# EasyEDA Pro project ESP32多功能手表工程文件.epro

# Schematic Schematic1
Assembly Variant: Basic; Board Name: Board1; Create Date: 2026-06-11; Page Name: P1; Project Name: ESP32-S3多功能手表v4.0; Schematic Name: Schematic1; Update Date: 2026-06-11; Company: 嘉立创EDA; Page Size: A4; Version: V1.0
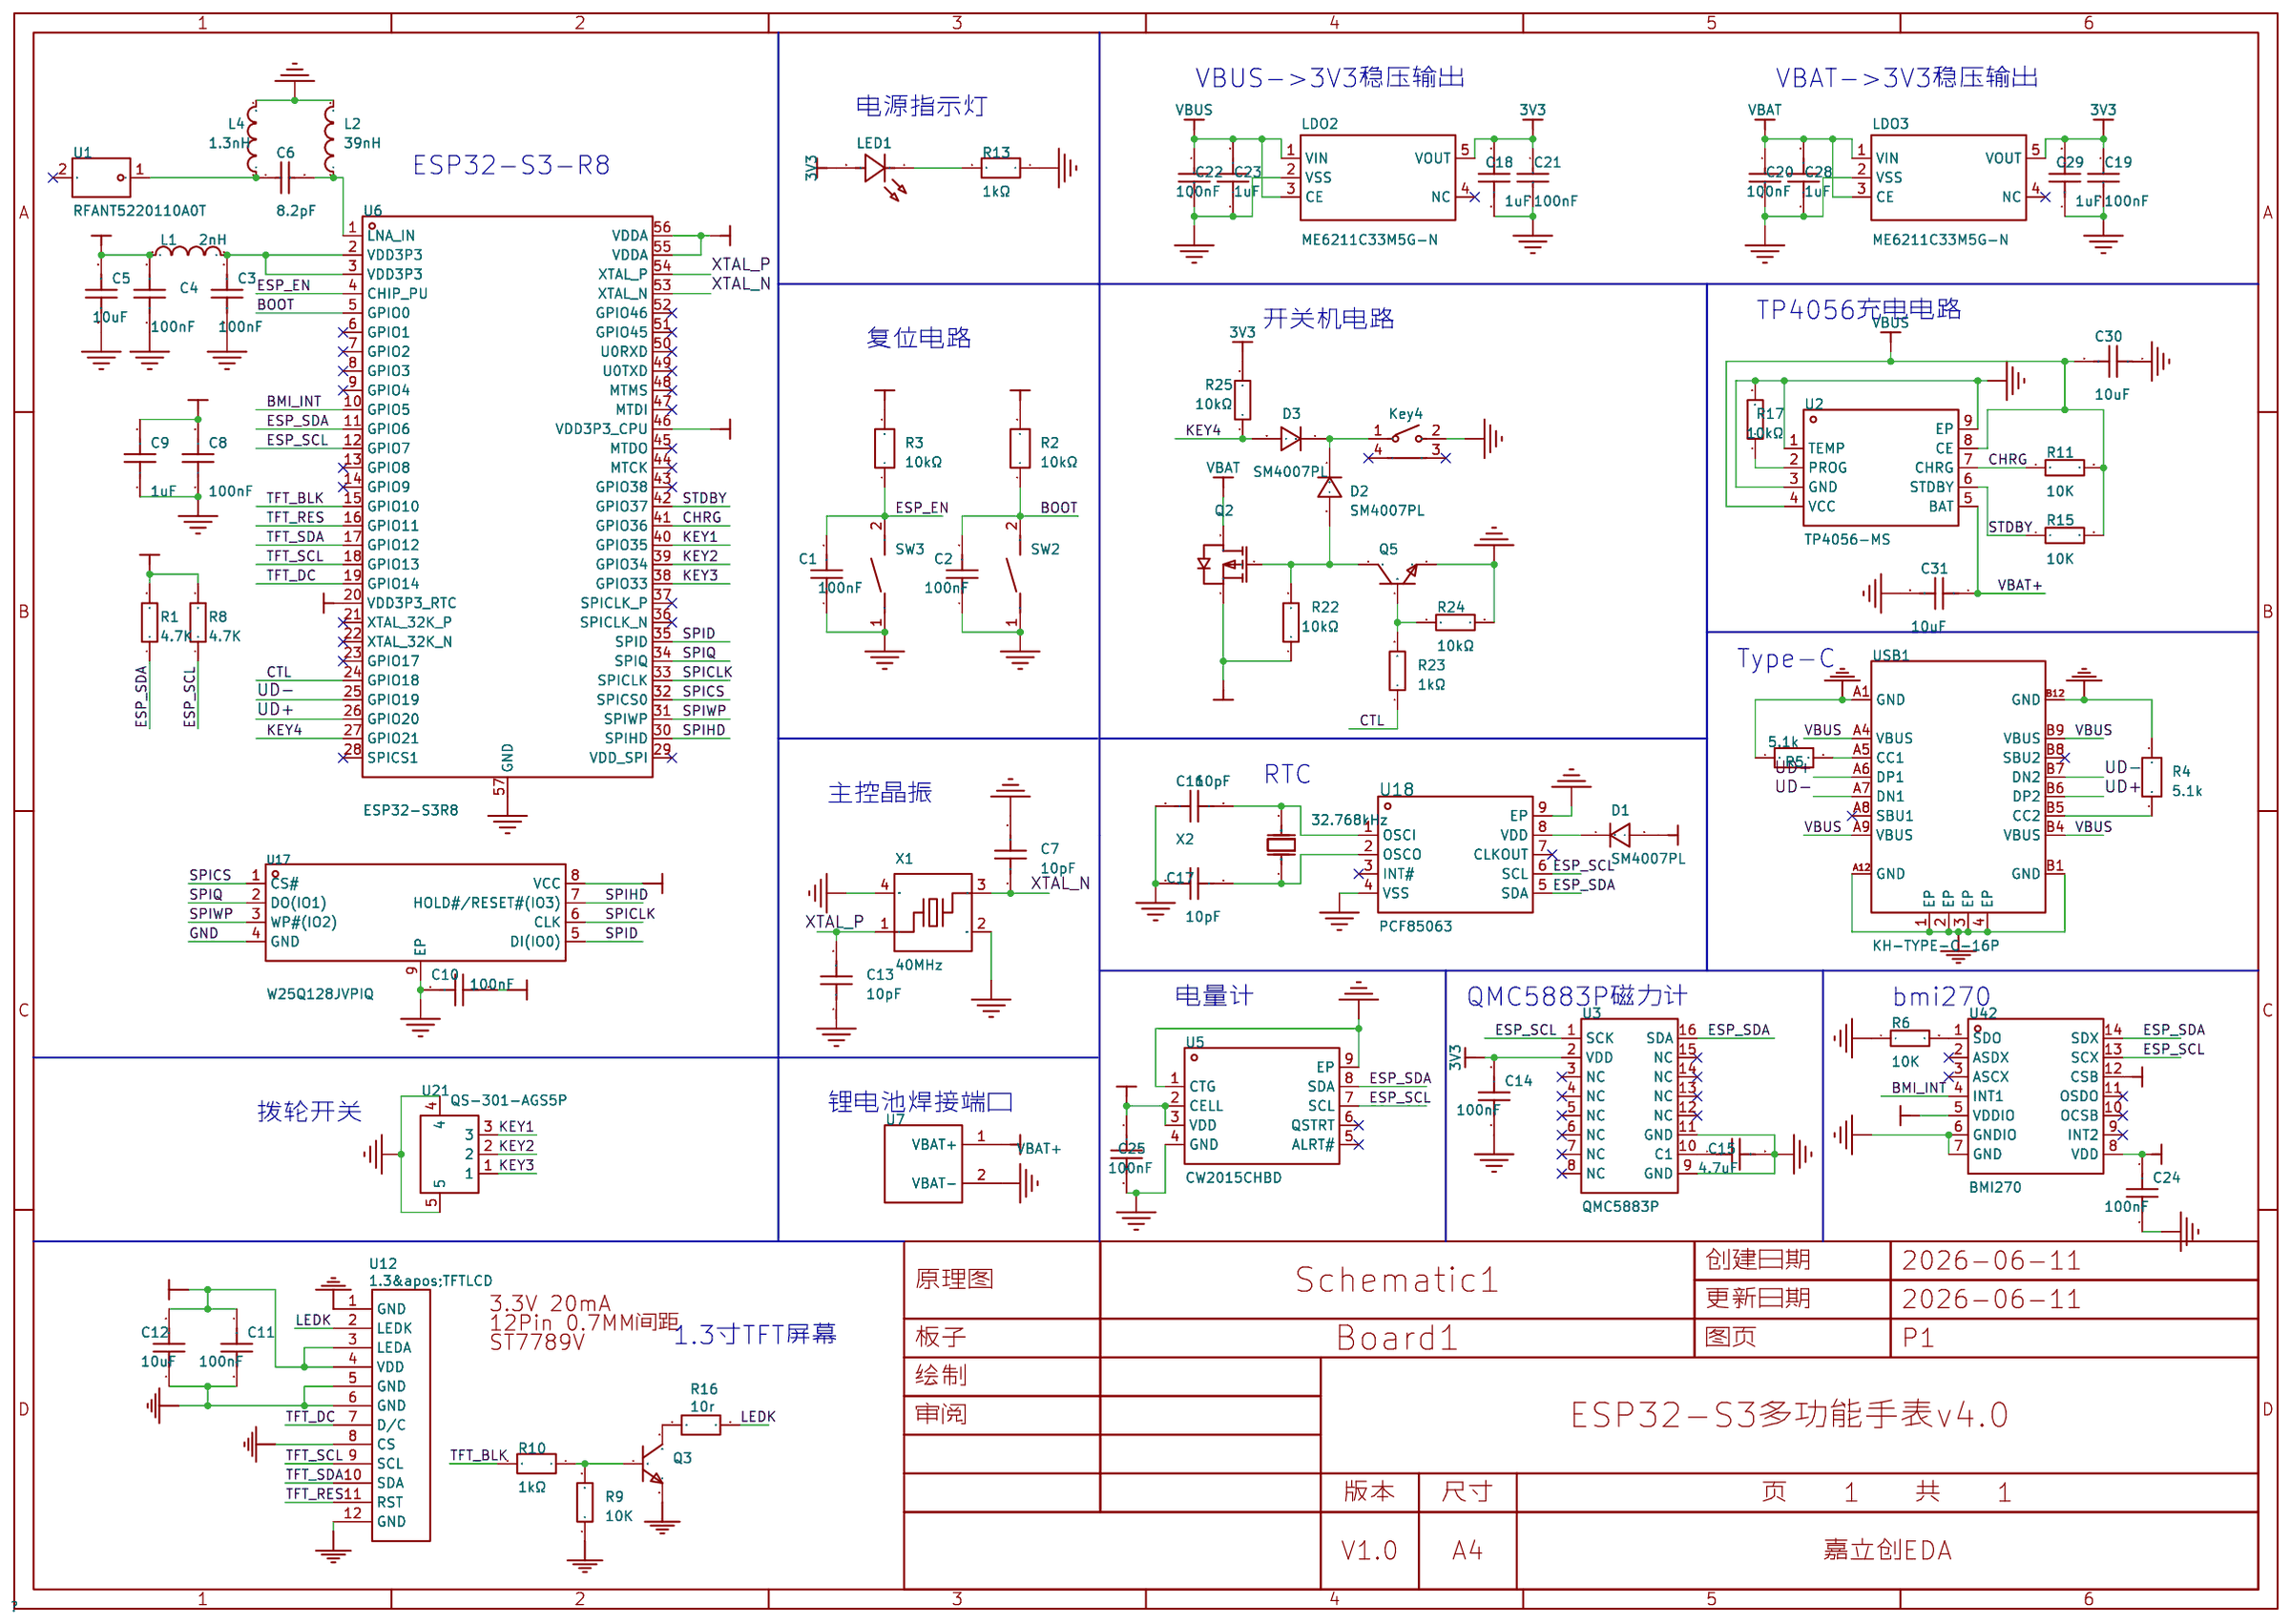
[diagram p0: schematic sheet]

## Parts
C1  100nF  [C0603]
C2  100nF  [C0603]
C3  100nF  [C0603]
C4  100nF  [C0603]
C5  10uF  [C0603]
C6  8.2pF  [C0402]
C7  10pF  [C0603]
C8  100nF  [C0603]
C9  1uF  [C0603]
C10  100nF  [C0603]
C11  100nF  [C0603]
C12  10uF  [C0603]
C13  10pF  [C0603]
C14  100nF  [C0603]
C15  4.7uF  [C0603]
C16  10pF  [C0603]
C17  10pF  [C0603]
C18  1uF  [C0603]
C19  100nF  [C0603]
C20  100nF  [C0603]
C21  100nF  [C0603]
C22  100nF  [C0603]
C23  1uF  [C0603]
C24  100nF  [C0603]
C25  100nF  [C0603]
C28  1uF  [C0603]
C29  1uF  [C0603]
C30  10uF  [C0603]
C31  10uF  [C0603]
D1  SM4007PL  [SOD-123F_L2.8-W1.8-LS3.7-RD]
D2  SM4007PL  [SOD-123F_L2.8-W1.8-LS3.7-RD]
D3  SM4007PL  [SOD-123F_L2.8-W1.8-LS3.7-RD]
L1  2nH  [L0603]
L2  39nH  [L0402]
L4  1.3nH  [L0402]
LDO2  ME6211C33M5G-N  [SOT-23-5_L3.0-W1.7-P0.95-LS2.8-BL]
LDO3  ME6211C33M5G-N  [SOT-23-5_L3.0-W1.7-P0.95-LS2.8-BL]
LED1  XL-1608SURC-06  [LED0603-RD_RED]
Q2  SI2301CDS-T1-GE3  [SOT-23-3_L3.0-W1.7-P0.95-LS2.9-BR]
Q3  SS8050  [SOT-23-3_L2.9-W1.3-P1.90-LS2.4-BR]
Q5  SS8050  [SOT-23-3_L2.9-W1.3-P1.90-LS2.4-BR]
R1  4.7K  [R0603]
R2  10kΩ  [R0603]
R3  10kΩ  [R0603]
R4  5.1k  [R0603]
R5  5.1k  [R0603]
R6  10K  [R0603]
R8  4.7K  [R0603]
R9  10K  [R0603]
R10  1kΩ  [R0603]
R11  10K  [R0603]
R13  1kΩ  [R0603]
R15  10K  [R0603]
R16  10r  [R0603]
R17  10kΩ  [R0603]
R22  10kΩ  [R0603]
R23  1kΩ  [R0603]
R24  10kΩ  [R0603]
R25  10kΩ  [R0603]
SW2  TS-1088-AR02016  [SW-SMD_L3.9-W3.0-P4.45]
SW3  TS-1088-AR02016  [SW-SMD_L3.9-W3.0-P4.45]
SW7  Key4  [SW-SMD_L4.7-W3.5-P3.35-EH]
U1  RFANT5220110A0T  [FILTER-SMD_L5.2-W2.0-L]
U2  TP4056-MS  [SOP-8_L4.9-W3.9-P1.27-LS6.0-TL-EP]
U3  QMC5883P  [LGA-16_L3.0-W3.0-P0.50-BL_SQ]
U5  CW2015CHBD  [TDFN-8_L3.0-W2.0-P0.50-BL-EP]
U6  ESP32-S3R8  [QFN-56_L7.0-W7.0-P0.40-TL-EP4.0]
U7  -  [302530BAT]
U12  1.3&apos;TFTLCD  [FPC-SMD_12P-P0.50_HB-FPC05-GXG-H2012P]
U17  W25Q128JVPIQ  [WSON-8_L5.0-W6.0-P1.27-BL-EP_1]
U18  PCF85063  [VSON-8_L2.0-W3.0-P0.50-BL-EP]
U21  QS-301-AGS5P  [SW-SMD_QS-301-AGS5P]
U42  BMI270  [LGA-14_L3.0-W2.5-P0.50-BL]
USB1  KH-TYPE-C-16P  [USB-C-SMD_KH-TYPE-C-16P]
X1  40MHz  [CRYSTAL-SMD_4P-L2.5-W2.0-BL]
X2  32.768kHz  [OSC-SMD_L2.0-W1.2]

## Library data of the parts
C1 C2 C11 C14 C24 C25 = CC0603KRX7R9BB104: 容值:100nF;精度:±10%;额定电压:50V;温度系数:X7R;; LCSC Part Name: 100nF ±10% 50V; Supplier Part: C14663; Manufacturer: YAGEO(国巨); Supplier Footprint: 0603; JLCPCB Part Class: 基础库; Datasheet: https://atta.szlcsc.com/upload/public/pdf/source/20180910/C282072_33301C7F631E79921B82A8DAC6BCC5B3.pdf; Supplier: LCSC; Tolerance: ±10%; Voltage Rating: 50V; Temperature Coefficient: X7R
C3-C5 C7-C10 C13 C16 C17 = CAP_0603: Supplier Footprint: 0603
C6 = 0402CG8R2C500NT: 容值:8.2pF;额定电压:50V;温度系数:C0G;; LCSC Part Name: ±0.25pF 8.2pF 50V; Supplier Part: C1579; Manufacturer: FH(风华); Supplier Footprint: 0402; JLCPCB Part Class: Extended Part; Datasheet: https://item.szlcsc.com/datasheet/0402CG8R2C500NT/1931.html; Supplier: LCSC; Voltage Rating: 50V; Temperature Coefficient: C0G
C12 C30 C31 = CL10A106KP8NNNC: 容值:10uF;精度:±10%;额定电压:10V;材质(温度系数):X5R;; LCSC Part Name: 10uF ±10% 10V; Supplier Part: C19702; Manufacturer: SAMSUNG(三星); Supplier Footprint: 0603; JLCPCB Part Class: 基础库; Datasheet: https://atta.szlcsc.com/upload/public/pdf/source/20160218/1457707763339.pdf; Supplier: LCSC; Tolerance: ±10%; Voltage Rated: 10V; Temperature Coefficient: X5R
C15 = CGA0603X5R475K350JT: 容值:4.7uF;精度:±10%;额定电压:35V;温度系数:X5R;; LCSC Part Name: 4.7uF ±10% 35V; Supplier Part: C6119851; Manufacturer: HRE(芯声); Supplier Footprint: 0603; JLCPCB Part Class: Extended Part; Datasheet: https://item.szlcsc.com/datasheet/CGA0603X5R475K350JT/7062557.html; Supplier: LCSC; Tolerance: ±10%; Voltage Rating: 35V; Temperature Coefficient: X5R
C18 C23 C28 C29 = CL10A105KB8NNNC: 容值:1uF;精度:±10%;额定电压:50V;材质(温度系数):X5R;; LCSC Part Name: 1uF ±10% 50V; Supplier Part: C15849; Manufacturer: SAMSUNG(三星); Supplier Footprint: 0603; JLCPCB Part Class: 基础库; Datasheet: https://atta.szlcsc.com/upload/public/pdf/source/20160218/1457707763339.pdf; Supplier: LCSC; Tolerance: ±10%; Voltage Rated: 50V; Temperature Coefficient: X5R
C19-C22 = 0603B104K500NT: 容值:100nF;精度:±10%;额定电压:50V;温度系数:X7R;; LCSC Part Name: 100nF ±10% 50V; Supplier Part: C30926; Manufacturer: FH(风华); Supplier Footprint: 0603; JLCPCB Part Class: 扩展库; Datasheet: https://atta.szlcsc.com/upload/public/pdf/source/20200305/C486355_26A10D38EF8C2A5C37091D0039909270.pdf; Supplier: LCSC; Tolerance: ±10%; Voltage Rating: 50V; Temperature Coefficient: X7R
D1-D3 = SM4007PL_C64898: 二极管配置:独立式;正向压降(Vf):1.1V@1A;直流反向耐压(Vr):1kV;整流电流:1A;; Supplier Part: C64898; Manufacturer: MDD(辰达半导体); Supplier Footprint: SOD-123FL; Datasheet: https://atta.szlcsc.com/upload/public/pdf/source/20241121/400BA5297D1B92A42708AD93AB64CE21.pdf; Supplier: LCSC; Diode Configuration: 独立式; Voltage - Forward(Vf@If): 1.1V@1A; Voltage - DC Reverse(Vr): 1kV; Current - Rectified: 1A; Reverse Leakage Current (Ir): 10uA@1kV
L1 = L_0603
L2 = SDCL1005C39NJTDF: 电感值:39nH;精度:±5%;额定电流:200mA;饱和电流(Isat):-;直流电阻(DCR):1Ω;; LCSC Part Name: 39nH ±5%; Supplier Part: C26443; Manufacturer: Sunlord(顺络); Supplier Footprint: 0402; JLCPCB Part Class: Extended Part; Datasheet: https://item.szlcsc.com/datasheet/SDCL1005C39NJTDF/27187.html; Supplier: LCSC; Tolerance: ±5%; Current Rating: 200mA; DC Resistance(DCR): 1Ω; Q @ Frequency: 8@100MHz; Frequency - Self Resonant: 1.2GHz
L4 = LQG15HS1N3S02D: 电感值:1.3nH;精度:-;额定电流:1A;饱和电流(Isat):-;直流电阻(DCR):70mΩ;; LCSC Part Name: ±0.3nH 1.3nH; Supplier Part: C97996; Manufacturer: muRata(村田); Supplier Footprint: 0402; JLCPCB Part Class: Extended Part; Datasheet: https://item.szlcsc.com/datasheet/LQG15HS1N3S02D/99205.html; Supplier: LCSC; Current Rating: 1A; DC Resistance(DCR): 70mΩ; Q @ Frequency: 8@100MHz; Frequency - Self Resonant: 6GHz
LDO2 LDO3 = ME6211C33M5G-N: 输出类型:固定;工作电压:6V;输出电压:3.3V;输出电流:500mA;电源纹波抑制比(PSRR):70dB@(1kHz)；62dB@(10kHz);输出极性:正极;; LCSC Part Name: 输入6V 输出3.3V 500mA; Supplier Part: C82942; Manufacturer: MICRONE(南京微盟); Supplier Footprint: SOT-23-5; JLCPCB Part Class: 扩展库; Datasheet: https://atta.szlcsc.com/upload/public/pdf/source/20170918/C82942_1505727073070976520.pdf; Supplier: LCSC; Output Type: 固定; Voltage - Supply: 6V; Output Voltage: 3.3V; Output Current: 500mA; Power Supply Rejection Ratio (PSRR): 70dB@(1kHz)；62dB@(10kHz); Voltage Dropout: 260mV@(200mA); Features: 短路保护(SCP)；低ESR；过流保护(OCP)；带使能; Output Configuration: 正极; Number of Outputs: 1
LED1 = XL-1608SURC-06: 灯头类型:-;发光颜色:红色;正向压降(Vf):2.3V;功率:50mW;正向电流:20mA;波长:620nm~630nm;二极管配置:-;透镜颜色:无色透明透镜;色温:-;发光强度:225mcd;发光角度:120°;载带方式:正贴;工作温度:-20℃~+85℃;; Supplier Part: C965799; Manufacturer: XINGLIGHT(成兴光); Supplier Footprint: 0603; JLCPCB Part Class: 扩展库; Datasheet: https://atta.szlcsc.com/upload/public/pdf/source/20250213/F9766CE804AF391355DCDD48DB3E0DAB.pdf; Supplier: LCSC; Illumination Color: 红色; Voltage - Forward(Vf): 2.3V; Power(Watts): 50mW; Forward Current: 20mA; Wavelength - Dominant: 620nm~630nm; Peak Wavelength: 625nm; Lens Color: 无色透明透镜; Luminous Intensity: 225mcd; Viewing Angle: 120°; Mounting Sytle: 正贴; Operating Temperature: -20℃~+85℃
Q2 = SI2301CDS-T1-GE3: 类型:1个P沟道;漏源电压(Vdss):20V;连续漏极电流(Id):2.3A;导通电阻(RDS(on)@Vgs,Id):112mΩ@4.5V,2.8A;功率(Pd):860mW;阈值电压(Vgs(th)@Id):1V@250uA;; LCSC Part Name: 1个P沟道 耐压:20V 电流:2.3A; Supplier Part: C10487; Manufacturer: VISHAY(威世); Supplier Footprint: SOT-23; Datasheet: https://atta.szlcsc.com/upload/public/pdf/source/20180621/C10487_757133A2CC00440C4C7DD3E7E73681E9.pdf; Supplier: LCSC; Type: 1个P沟道; Drain Source Voltage (Vdss): 20V; Continuous Drain Current (Id): 2.3A; Drain Source On Resistance (RDS(on)@Vgs,Id): 112mΩ@4.5V,2.8A; Power Dissipation (Pd): 860mW; Gate Threshold Voltage (Vgs(th)@Id): 1V@250uA; Total Gate Charge (Qg@Vgs): 3.3nC@10V; Input Capacitance (Ciss@Vds): 405pF@10V; Reverse Transfer Capacitance (Crss@Vds): 55pF@10V; Operating Temperature: -55℃~+150℃
Q3 Q5 = SS8050_C7420370: 晶体管类型:NPN;集电极电流(Ic):1.5A;集射极击穿电压(Vceo):25V;耗散功率(Pd):300mW;直流电流增益(hFE):120@100mA,1.0V;; LCSC Part Name: H档 200-350; Supplier Part: C7420370; Manufacturer: 宏嘉诚; Supplier Footprint: SOT-23; JLCPCB Part Class: 扩展库; Datasheet: https://atta.szlcsc.com/upload/public/pdf/source/20250205/5DB94E86981B5B1A1866D18E379C0D4F.pdf; Supplier: LCSC; type: NPN; Current - Collector(Ic): 1.5A; Collector - Emitter Voltage VCEO: 25V; Pd - Power Dissipation: 300mW; DC Current Gain: 120@100mA,1.0V; Transition frequency(fT): 100MHz; Current - Collector Cutoff: 100nA; Vce Saturation(VCE(sat)): 500mV; Operating Temperature: -55℃~+150℃
R1 R6 R8 R9 R11 R15 = Res_0603: Supplier Footprint: 0603
R2 R3 = FRC0603F1002TS: 电阻类型:厚膜电阻;阻值:10kΩ;精度:±1%;功率:100mW;工作电压:75V;温度系数:±100ppm/℃;; LCSC Part Name: 10kΩ ±1% 100mW 厚膜电阻; Supplier Part: C2906982; Manufacturer: FOJAN(富捷); Supplier Footprint: 0603; JLCPCB Part Class: Extended Part; Supplier: LCSC; Type: 厚膜电阻; Tolerance: ±1%; Power(Watts): 100mW; Voltage-Supply(Max): 75V; Temperature Coefficient: ±100ppm/℃; Operating Temperature: -55℃~+155℃
R4 R5 = 5.1k
R10 R13 = FRC0603F1001TS: 电阻类型:厚膜电阻;阻值:1kΩ;精度:±1%;功率:100mW;最大工作电压:75V;温度系数:±100ppm/℃;; LCSC Part Name: 1kΩ ±1% 100mW 厚膜电阻; Supplier Part: C2907002; Manufacturer: FOJAN(富捷); Supplier Footprint: 0603; JLCPCB Part Class: 扩展库; Datasheet: https://atta.szlcsc.com/upload/public/pdf/source/20211221/925EC7D7225764EE0046F22065062C87.pdf; Supplier: LCSC; Type: 厚膜电阻; Tolerance: ±1%; Power(Watts): 100mW; Overload Voltage (Max): 75V; Temperature Coefficient: ±100ppm/℃; Operating Temperature Range: -55℃~+155℃
R16 = 10r
R17 R22 R24 R25 = 10k 0603: 电阻类型:厚膜电阻;阻值:10kΩ;精度:±1%;功率:100mW;最大工作电压:75V;温度系数:±100ppm/℃;; Manufacturer: UNI-ROYAL(厚声); Manufacturer Part: 0603WAF1002T5E; Supplier: LCSC; Supplier Part: C25804; LCSC Part Name: 厚膜电阻 10kΩ ±1% 100mW; Supplier Footprint: 0603; JLCPCB Part Class: Basic Part; Datasheet: https://atta.szlcsc.com/upload/public/pdf/source/20200306/C422600_1E6D84923E4A46A82E41ADD87F860B5C.pdf; Type: 厚膜电阻; Tolerance: ±1%; Power(Watts): 100mW; Overload Voltage (Max): 75V; Temperature Coefficient: ±100ppm/℃; Operating Temperature Range: -55℃~+155℃
R23 = 0603WAF1001T5E: 电阻类型:厚膜电阻;阻值:1kΩ;精度:±1%;功率:100mW;最大工作电压:75V;温度系数:±100ppm/℃;; LCSC Part Name: 1kΩ ±1% 100mW 厚膜电阻; Supplier Part: C21190; Manufacturer: UNI-ROYAL(厚声); Supplier Footprint: 0603; JLCPCB Part Class: 基础库; Datasheet: https://atta.szlcsc.com/upload/public/pdf/source/20200306/C422600_1E6D84923E4A46A82E41ADD87F860B5C.pdf; Supplier: LCSC; Type: 厚膜电阻; Tolerance: ±1%; Power(Watts): 100mW; Overload Voltage (Max): 75V; Temperature Coefficient: ±100ppm/℃; Operating Temperature Range: -55℃~+155℃
SW2 SW3 = TS-1088-AR02016: 电路结构:单刀单掷;按钮形状:圆形按钮;作用力:1.6N;安装方式:立贴;开关长度:4mm;开关宽度:3mm;开关高度:2mm;带支架:不带支架;触点电流:50mA;额定电压:12V;工作寿命:10万次;; LCSC Part Name: 4*3*2mm 立贴 轻触开关; Supplier Part: C720477; Manufacturer: XUNPU(讯普); Supplier Footprint: SMD,4x3mm; JLCPCB Part Class: Basic Part; Datasheet: https://item.szlcsc.com/datasheet/TS-1088-AR02016/763484.html; Supplier: LCSC; Circuit: 单刀单掷; Actuator Style: 圆形按钮; Operating Force: 1.6N; Mounting Type: 立贴; Length: 4mm; Width: 3mm; Switch Height: 2mm; with Bracket: 不带支架; Contact Current: 50mA; Voltage Rating: 12V; Actuator/Cap Color: 黑色; Termination Style: SMD接片; Life: 10万次; Operating Temperature: -30℃~+80℃
SW7 = GT-TC018A-H0375-L1: 电路结构:单刀单掷;按钮形状:矩形按钮;作用力:1.6N;安装方式:卧贴;开关长度:4.7mm;开关宽度:1.9mm;开关高度:3.75mm;带支架:不带;触点电流:50mA;额定电压(DC):12V;绝缘电阻:100MΩ;带灯:无;机械寿命:10万次;; LCSC Part Name: 4.7*1.9*3.75mm 卧贴 轻触开关; Supplier Part: C963235; Manufacturer: G-Switch(品赞); Supplier Footprint: SMD; JLCPCB Part Class: 扩展库; Datasheet: https://atta.szlcsc.com/upload/public/pdf/source/20201201/C963235_1379E8FB9A9D5A830B16F6A18B8D18DC.pdf; Supplier: LCSC; Circuit: 单刀单掷; Actuator Style: 矩形按钮; Operating Force: 1.6N; Mounting Style: 卧贴; Switch Length: 4.7mm; Switch Width: 1.9mm; Switch Height: 3.75mm; Strike Gundam: 不带; Contact Current: 50mA; Voltage Rating (DC): 12V; Insulation Resistance: 100MΩ; Actuator/Cap Color: 黑色; With Lamp: 无; Pin Style: SMD接片; Mechanical Life: 10万次; Operating Temperature: -30℃~+85℃
U1 = RFANT5220110A0T: 中心频率:2.45GHz;增益:2dBi;功率:5W;驻波比:2;; Supplier Part: C127611; Manufacturer: Walsin(华新科); Supplier Footprint: SMD,2x5.2mm; JLCPCB Part Class: Extended Part; Datasheet: https://item.szlcsc.com/datasheet/RFANT5220110A0T/138894.html; Supplier: LCSC; Frequency(Center/Band): 2.45GHz; Peak Gain: 2dBi; Power: 5W; VSWR: 2
U2 = TP4056-MS: 电源电压:4.2V~9V;最大充电电流:1A;电池类型:锂离子/聚合物;电池节数:1;; Supplier Part: C7473158; Manufacturer: MSKSEMI(美森科); Supplier Footprint: SOP-8-EP; JLCPCB Part Class: 扩展库; Datasheet: https://atta.szlcsc.com/upload/public/pdf/source/20230808/7F9175670C53D6763A7A5691214AEA38.pdf; Supplier: LCSC; Supply Voltage: 4.2V~9V; Maximum Charge Current: 1A; Type of Battery: 锂离子/聚合物; Number of Cells: 1; Operating Temperature: -40℃~+85℃
U3 = QMC5883P: QMC5883L停产，推荐使用 C2847467 QMC5883P替代; LCSC Part Name: 三轴磁传感器; Supplier Part: C2847467; Manufacturer: QST(上海矽睿); Supplier Footprint: LGA-16(3x3); JLCPCB Part Class: Extended Part; Datasheet: https://item.szlcsc.com/datasheet/QMC5883P/3044607.html; Supplier: LCSC; Magnetic Sensing Range(X,Y): ±3mT; Magnetic Sensing Range(Z): ±3mT; Output bit: 16bit; Interface Type: I2C; Voltage - Supply: 2.5V~3.6V; Current - Supply: 35uA; Operating Temperature: -40℃~+85℃; Features: 内置自检(BIST)；片上置位/复位线圈
U5 = CW2015CHBD: 工作电压:2.5V~4.5V;最大充电电流:-;电池类型:锂电池;电池节数:1;; LCSC Part Name: 具备低电量状态（SOC）警报功能的低成本电量计 IC; Supplier Part: C881838; Manufacturer: Cellwise(赛微); Supplier Footprint: TDFN-8-EP(2x3); JLCPCB Part Class: Extended Part; Datasheet: https://item.szlcsc.com/datasheet/CW2015CHBD/945357.html; Supplier: LCSC; The Chip Type: 监测芯片; Voltage - Supply: 2.5V~4.5V; Type of Battery: 锂电池; Number of Cells: 1; Operating Temperature: -20℃~+70℃; Battery Temperature Detection: 支持; 0V Battery Charge: 不支持; Supply Current (Iq): 500nA; Interface: I2C
U6 = ESP32-S3R8: 频率范围:2.412GHz~2.484GHz;接口类型:I2C；I2S；UART；USB；SPI;应用领域:蓝牙；WiFi;数据速率:150Mbps;灵敏度:-74.2dBm;典型应用频率:2.4GHz;; LCSC Part Name: 不带固件 2.4GHz Wi-Fi + 低功耗蓝牙系统级芯片（SoC）; Supplier Part: C2913194; Manufacturer: ESPRESSIF(乐鑫); Supplier Footprint: QFN-56(7x7); JLCPCB Part Class: Extended Part; Datasheet: https://item.szlcsc.com/datasheet/ESP32-S3R8/3198292.html; Supplier: LCSC; Frequency Range: 2.412GHz~2.484GHz; Interface: I2C；I2S；UART；USB；SPI; Voltage - Supply: 3V~3.6V; Applications: 蓝牙；WiFi; Output Power: 18.5dBm; Data Rate: 150Mbps; Current Of Transmitting: 283mA; Sensitivity: -74.2dBm; Receive Current: 88mA; Typical Application Frequency: 2.4GHz; Operating Temperature: -40℃~+65℃; Type: 收发器
U7 = 302530BAT
U12 = 1.3'TFTLCD
U17 = W25Q128JVPIQ: 存储容量:128Mbit;; Supplier Part: C2803379; Manufacturer: WINBOND(华邦); Supplier Footprint: WSON-8-EP(5x6); JLCPCB Part Class: 扩展库; Datasheet: https://atta.szlcsc.com/upload/public/pdf/source/20190705/C401662_06B6D416F67ED315879B366F63A3F7C9.pdf; Supplier: LCSC; Memory Size: 128Mbit
U18 = PCF85063TP/1Z: Supplier Part: C126170; Manufacturer: NXP(恩智浦); Supplier Footprint: VSON-8-EP(2x3); JLCPCB Part Class: 扩展库; Datasheet: https://atta.szlcsc.com/upload/public/pdf/source/20191129/C126170_981191297460F7359CEAC0EA84BD6628.pdf; Supplier: LCSC; Supply Voltage: 900mV~5.5V; Input Low Voltage: 0V~1.65V; Intput High Voltage: 0.63V~5.5V; Output Low Voltage: 0V~1.1V; Output High Voltage: 0.72V~5.5V; Operating Temperatue: -40℃~+85℃
U21 = QS-301-AGS5P: LCSC Part Name: 三脚 大头拨轮多功能开关 MP3/MP4换曲按键; Supplier Part: C42377853; Manufacturer: XUNPU(讯普); Supplier Footprint: SMD; Datasheet: https://atta.szlcsc.com/upload/public/pdf/source/20241106/28956C8F7821B982CBB1BD5B1BCE3D5A.pdf; Supplier: LCSC
U42 = BMI270: 传感器类型:加速度计陀螺仪;; Supplier Part: C2836813; Manufacturer: Bosch(博世); Supplier Footprint: LGA-14(2.5x3); JLCPCB Part Class: 扩展库; Datasheet: https://atta.szlcsc.com/upload/public/pdf/source/20210625/C2836813_35E1F3F92097F45A3828DF13DDBA01A5.pdf; Supplier: LCSC; Sensor Type: 加速度计陀螺仪; Operating Temperature: -40℃~+85℃
USB1 = KH-TYPE-C-16P: 连接器类型:Type-C;协议标准:-;公母:母;安装方式:卧贴;触点数量:16P;端口数量:1;额定电流 - 电源:3A;工作温度:-40℃~+85℃;; LCSC Part Name: Type-C 母 卧贴; Supplier Part: C709357; Manufacturer: kinghelm(金航标); Supplier Footprint: SMD; JLCPCB Part Class: Extended Part; Datasheet: https://item.szlcsc.com/datasheet/KH-TYPE-C-16P/747093.html; Supplier: LCSC; Connector Type: Type-C; Gender: 母; Mounting Type: 卧贴; Number of Contacts: 16P; Number of Ports: 1; Current Rating-Power: 3A; Voltage Rating: 30V; Connect-Disconnect Life: 1万次; Length: 7.81mm; Operating Temperature: -40℃~+85℃
X1 = 40MHz: Supplier: LCSC; Supplier Part: C555614; Manufacturer: JGHC(晶光华); JLCPCB Part Class: Extended Part
X2 = X201232768KJD2SI: 晶振类型:贴片晶振;频率:32.768kHz;常温频差:±20ppm;外接负载电容:7pF;频率稳定度(全温):±30ppm;; LCSC Part Name: 32.768kHz ±20ppm 7pF; Supplier Part: C383843; Manufacturer: YXC(扬兴晶振); Supplier Footprint: SMD2012-2P; Datasheet: https://atta.szlcsc.com/upload/public/pdf/source/20240329/EAF6156B280A4D2FB21BB6AE3B6FE94A.pdf; Supplier: LCSC; Crystal Type: 贴片晶振; Normal temperature Frequency Tolerance: ±20ppm; External load capacitor: 7pF; Frequency Stability(Full temperature range): ±30ppm; Operating Temperature: -40℃~+85℃

## Nets
3V3: C4.2 C5.2 C8.2 C9.2 C10.1 C11.1 C12.2 C14.1 C18.2 C19.1 C21.1 C24.1 C29.2 L1.1 LDO2.5(VOUT) LDO3.5(VOUT) LED1.2(A) R1.2 R2.2 R3.2 R8.2 R25.2 U3.2(VDD) U6.20(VDD3P3_RTC) U6.46(VDD3P3_CPU) U6.55(VDDA) U6.56(VDDA) U12.3(LEDA) U12.4(VDD) U17.8(VCC) U42.5(VDDIO) U42.8(VDD) U42.12(CSB)
GND: C1.1 C2.1 C3.1 C4.1 C5.1 C7.2 C8.1 C9.1 C10.2 C11.2 C12.1 C13.1 C14.2 C15.2 C16.2 C17.2 C18.1 C19.2 C20.2 C21.2 C22.2 C23.1 C24.2 C25.2 C28.1 C29.1 C30.1 C31.2 L2.2 L4.2 LDO2.2(VSS) LDO3.2(VSS) Q3.2(E) Q5.2(E) R4.2 R5.1 R6.1 R9.1 R13.1 R17.2 R24.1 SW2.1 SW3.1 SW7.2 U2.1(TEMP) U2.3(GND) U2.9(EP) U3.9(GND) U3.11(GND) U5.1(CTG) U5.4(GND) U5.9(EP) U6.57(GND) U7.2(VBAT-) U12.1(GND) U12.5(GND) U12.6(GND) U12.8(CS) U12.12(GND) U17.4(GND) U17.9(EP) U18.4(VSS) U18.9(EP) U21.4 U21.5 U42.6(GNDIO) U42.7(GND) USB1.1(EP) USB1.2(EP) USB1.3(EP) USB1.4(EP) USB1.A1(GND) USB1.A12(GND) USB1.B1(GND) USB1.B12(GND) X1.2(GND) X1.4(GND)
VBAT: C20.1 C28.2 LDO3.1(VIN) LDO3.3(CE) Q2.3(D)
VBAT+: C25.1 C31.1 D1.2(A) Q2.2(S) R22.1 U2.5(BAT) U5.2(CELL) U5.3(VDD) U7.1(VBAT+)
VBUS: C22.1 C23.2 C30.2 LDO2.1(VIN) LDO2.3(CE) R11.2 R15.2 U2.4(VCC) U2.8(CE) USB1.A4(VBUS) USB1.A9(VBUS) USB1.B4(VBUS) USB1.B9(VBUS)
BMI_INT: U6.10(GPIO5) U42.4(INT1)
BOOT: C2.2 R2.1 SW2.2 U6.5(GPIO0)
CHRG: R11.1 U2.7(CHRG) U6.41(GPIO36)
CTL: R23.1 U6.24(GPIO18)
ESP_EN: C1.2 R3.1 SW3.2 U6.4(CHIP_PU)
ESP_SCL: R8.1 U3.1(SCK) U5.7(SCL) U6.12(GPIO7) U18.6(SCL) U42.13(SCX)
ESP_SDA: R1.1 U3.16(SDA) U5.8(SDA) U6.11(GPIO6) U18.5(SDA) U42.14(SDX)
KEY1: U6.40(GPIO35) U21.3
KEY2: U6.39(GPIO34) U21.2
KEY3: U6.38(GPIO33) U21.1
KEY4: D3.2(A) R25.1 U6.27(GPIO21)
LEDK: R16.2 U12.2(LEDK)
SPICLK: U6.33(SPICLK) U17.6(CLK)
SPICS: U6.32(SPICS0) U17.1(CS#)
SPID: U6.35(SPID) U17.5(DI(IO0))
SPIHD: U6.30(SPIHD) U17.7(HOLD#/RESET#(IO3))
SPIQ: U6.34(SPIQ) U17.2(DO(IO1))
SPIWP: U6.31(SPIWP) U17.3(WP#(IO2))
STDBY: R15.1 U2.6(STDBY) U6.42(GPIO37)
TFT_BLK: R10.2 U6.15(GPIO10)
TFT_DC: U6.19(GPIO14) U12.7(D/C)
TFT_RES: U6.16(GPIO11) U12.11(RST)
TFT_SCL: U6.18(GPIO13) U12.9(SCL)
TFT_SDA: U6.17(GPIO12) U12.10(SDA)
UD+: U6.26(GPIO20) USB1.A6(DP1) USB1.B6(DP2)
UD-: U6.25(GPIO19) USB1.A7(DN1) USB1.B7(DN2)
XTAL_N: C7.1 U6.53(XTAL_N) X1.3
XTAL_P: C13.2 U6.54(XTAL_P) X1.1
$1N92: C6.2 L2.1 U6.1(LNA_IN)
$1N111: C6.1 L4.1 U1.1
$1N112: C3.2 L1.2 U6.2(VDD3P3) U6.3(VDD3P3)
$1N141: LED1.1(K) R13.2
$1N183: D2.2(A) Q2.1(G) Q5.3(C) R22.2
$1N184: Q5.1(B) R23.2 R24.2
$1N187: D2.1(C) D3.1(C) SW7.1
$1N194: R17.1 U2.2(PROG)
$1N208: C15.1 U3.10(C1)
$1N222: R5.2 USB1.A5(CC1)
$1N223: R4.1 USB1.B5(CC2)
$1N228: D1.1(C) U18.8(VDD)
$1N236: R6.2 U42.1(SDO)
$1N245: C16.1 U18.1(OSCI) X2.2(OSC2)
$1N246: C17.1 U18.2(OSCO) X2.1(OSC1)
$1N265: Q3.1(B) R9.2 R10.1
$1N297: Q3.3(C) R16.1

Not connected (* = marked no-connect by the designer): LDO2 4(NC)*; LDO3 4(NC)*; SW7 3* 4*; U1 2*; U3 3(NC)* 4(NC)* 5(NC)* 6(NC)* 7(NC)* 8(NC)* 12(NC)* 13(NC)* 14(NC)* 15(NC)*; U5 5(ALRT#)* 6(QSTRT)*; U6 6(GPIO1)* 7(GPIO2)* 8(GPIO3)* 9(GPIO4)* 13(GPIO8)* 14(GPIO9)* 21(XTAL_32K_P)* 22(XTAL_32K_N)* 23(GPIO17)* 28(SPICS1)* 29(VDD_SPI)* 36(SPICLK_N)* 37(SPICLK_P)* 43(GPIO38)* 44(MTCK)* 45(MTDO)* 47(MTDI)* 48(MTMS)* 49(U0TXD)* 50(U0RXD)* 51(GPIO45)* 52(GPIO46)*; U18 3(INT#)* 7(CLKOUT)*; U42 2(ASDX)* 3(ASCX)* 9(INT2)* 10(OCSB)* 11(OSDO)*; USB1 A8(SBU1)* B8(SBU2)*

## Notes on the sheet
- VBUS->3V3稳压输出
- VBAT->3V3稳压输出
- 电源指示灯
- ESP32-S3-R8
- 开关机电路
- TP4056充电电路
- 复位电路
- Type-C
- RTC
- 主控晶振
- 电量计
- QMC5883P磁力计
- bmi270
- 锂电池焊接端口
- 拨轮开关
- 1.3寸TFT屏幕

# Board PCB1
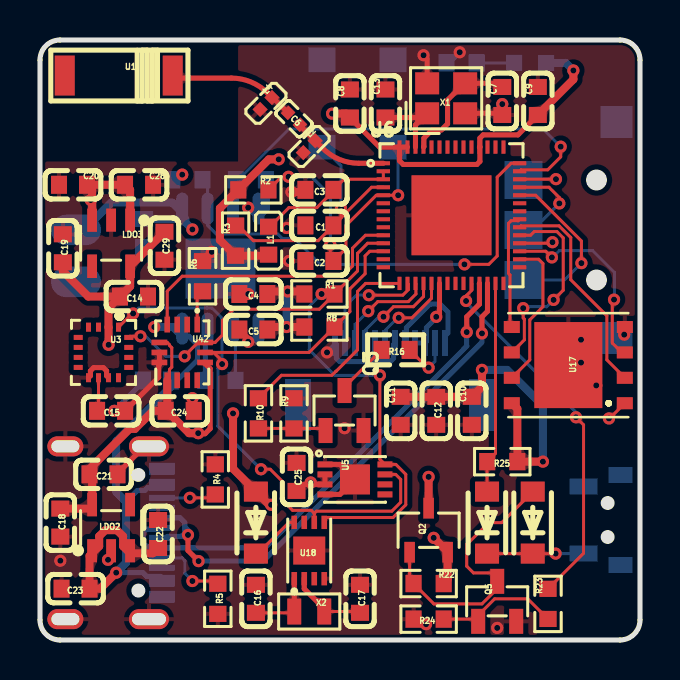
[diagram p1: board, top side]
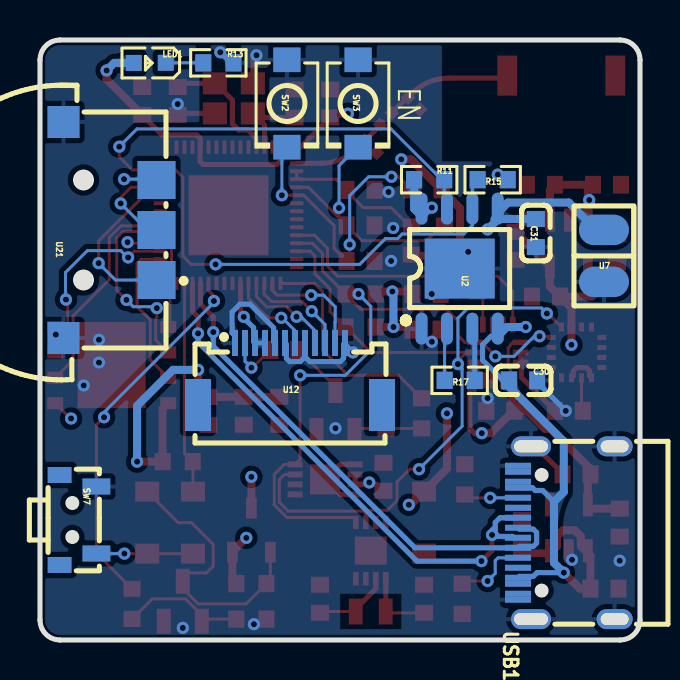
[diagram p2: board, bottom side, seen from below]

Outline 30 x 30 mm; copper layers: Top Layer, GND, PWR, Bottom Layer. Coordinates in mm from the lower left corner of the outline.
Outline path: 0,29 0,1 arc(0.29,0.29) 1,0 29,0 arc(29.71,0.29) 30,1 30,29 arc(29.71,29.71) 29,30 1,30 arc(0.29,29.71) 0,29
Stack: Top Layer 0.035mm Outer layer thickness 1oz / Dielectric1 0.2104mm 7628 RC49% 8.6mil / GND 0.0152mm Inner layer thickness / Dielectric2 1.065mm 1.1mm H/HOZ Copper / PWR 0.0152mm Inner layer thickness / Dielectric3 0.2104mm 7628 RC49% 8.6mil / Bottom Layer 0.035mm Outer layer thickness 1oz

## Design rules (mm)
spacing copperThickness1oz (default): track to track 0.102, other pairs 0.152 to 0.3
spacing copperThickness2oz: track to track 0.203, other pairs 0.152 to 0.3
track width copperThickness1oz (default): min 0.127, default 0.254, max 2.54
track width copperThickness2oz: min 0.203, default 0.254, max 2.54
differential pair differentialPair (default): width min 0.127, default 0.254, max 2.54; gap min 0.152, default 0.152
net GND uses copperRegion

## Placement (name value [footprint] x y rotation side)
C1  100nF  [C0603]  13.97 20.73 0 top
C2  100nF  [C0603]  13.97 18.95 0 top
C3  100nF  [C0603]  13.97 22.51 0 top
C4  100nF  [C0603]  10.67 17.3 0 top
C5  10uF  [C0603]  10.67 15.52 0 top
C6  8.2pF  [C0402]  12.7 26.06 315 top
C7  10pF  [C0603]  23.11 26.95 270 top
C8  100nF  [C0603]  15.49 26.83 270 top
C9  1uF  [C0603]  24.89 26.95 270 top
C10  100nF  [C0603]  21.59 11.46 270 top
C11  100nF  [C0603]  18.03 11.46 270 top
C12  10uF  [C0603]  19.81 11.46 90 top
C13  10pF  [C0603]  17.27 26.83 270 top
C14  100nF  [C0603]  4.7 17.17 0 top
C15  4.7uF  [C0603]  3.56 11.46 0 top
C16  10pF  [C0603]  10.79 2.06 90 top
C17  10pF  [C0603]  16 2.06 90 top
C18  1uF  [C0603]  1.02 5.87 90 top
C19  100nF  [C0603]  1.14 19.59 90 top
C20  100nF  [C0603]  1.65 22.76 180 top
C21  100nF  [C0603]  3.18 8.28 0 top
C22  100nF  [C0603]  5.9 5.3 90 top
C23  1uF  [C0603]  1.78 2.57 0 top
C24  100nF  [C0603]  6.99 11.46 0 top
C25  100nF  [C0603]  12.83 8.16 90 top
C28  1uF  [C0603]  4.95 22.76 180 top
C29  1uF  [C0603]  6.22 19.71 90 top
C30  10uF  [C0603]  5.84 12.98 0 bottom
C31  10uF  [C0603]  5.21 20.35 270 bottom
D1  SM4007PL  [SOD-123F_L2.8-W1.8-LS3.7-RD]  10.79 5.87 90 top
D2  SM4007PL  [SOD-123F_L2.8-W1.8-LS3.7-RD]  24.64 5.87 90 top
D3  SM4007PL  [SOD-123F_L2.8-W1.8-LS3.7-RD]  22.35 5.87 90 top
L1  2nH  [L0603]  11.43 19.97 90 top
L2  39nH  [L0402]  13.46 24.67 225 top
L4  1.3nH  [L0402]  11.3 26.83 225 top
LDO2  ME6211C33M5G-N  [SOT-23-5_L3.0-W1.7-P0.95-LS2.8-BL]  3.56 5.62 0 top
LDO3  ME6211C33M5G-N  [SOT-23-5_L3.0-W1.7-P0.95-LS2.8-BL]  3.56 19.84 180 top
LED1  XL-1608SURC-06  [LED0603-RD_RED]  24.51 28.86 0 bottom
Q2  SI2301CDS-T1-GE3  [SOT-23-3_L3.0-W1.7-P0.95-LS2.9-BR]  19.43 5.49 270 top
Q3  SS8050  [SOT-23-3_L2.9-W1.3-P1.90-LS2.4-BR]  15.23 11.47 270 top
Q5  SS8050  [SOT-23-3_L2.9-W1.3-P1.90-LS2.4-BR]  22.86 1.93 270 top
R1  4.7K  [R0603]  13.97 17.3 180 top
R2  10kΩ  [R0603]  10.67 22.51 180 top
R3  10kΩ  [R0603]  9.78 19.97 270 top
R4  5.1k  [R0603]  8.76 8.03 90 top
R5  5.1k  [R0603]  8.89 2.06 90 top
R6  10K  [R0603]  8.13 18.19 270 top
R8  4.7K  [R0603]  13.97 15.65 180 top
R9  10K  [R0603]  12.7 11.33 270 top
R10  1kΩ  [R0603]  10.92 11.33 90 top
R11  10K  [R0603]  10.54 23.02 0 bottom
R13  1kΩ  [R0603]  21.08 28.86 0 bottom
R15  10K  [R0603]  7.37 23.02 180 bottom
R16  10r  [R0603#2]  17.78 14.51 0 top
R17  10kΩ  [R0603]  9.02 12.98 180 bottom
R22  10kΩ  [R0603]  19.43 2.82 180 top
R23  1kΩ  [R0603]  25.4 1.81 270 top
R24  10kΩ  [R0603]  19.43 1.04 0 top
R25  10kΩ  [R0603]  23.11 8.92 0 top
SW2  TS-1088-AR02016  [SW-SMD_L3.9-W3.0-P4.45]  17.65 26.83 270 bottom
SW3  TS-1088-AR02016  [SW-SMD_L3.9-W3.0-P4.45]  14.1 26.83 270 bottom
SW7  Key4  [SW-SMD_L4.7-W3.5-P3.35-EH]  28.1 6 90 bottom
U1  RFANT5220110A0T  [FILTER-SMD_L5.2-W2.0-L]  3.94 28.22 180 top
U2  TP4056-MS  [SOP-8_L4.9-W3.9-P1.27-LS6.0-TL-EP]  9.02 18.57 90 bottom
U3  QMC5883P  [LGA-16_L3.0-W3.0-P0.50-BL_SQ]  3.18 14.38 180 top
U5  CW2015CHBD  [TDFN-8_L3.0-W2.0-P0.50-BL-EP]  15.75 8.03 270 top
U6  ESP32-S3R8  [QFN-56_L7.0-W7.0-P0.40-TL-EP4.0]  20.57 21.24 0 top
U7  -  [302530BAT]  3.3 19.2 180 bottom
U12  1.3&apos;TFTLCD  [FPC-SMD_12P-P0.50_HB-FPC05-GXG-H2012P]  17.5 13.3 180 bottom
U17  W25Q128JVPIQ  [WSON-8_L5.0-W6.0-P1.27-BL-EP_1]  26.42 13.74 90 top
U18  PCF85063  [VSON-8_L2.0-W3.0-P0.50-BL-EP]  13.46 4.47 0 top
U21  QS-301-AGS5P  [SW-SMD_QS-301-AGS5P]  26.5 20.5 90 bottom
U42  BMI270  [LGA-14_L3.0-W2.5-P0.50-BL]  7.11 14.38 180 top
USB1  KH-TYPE-C-16P  [USB-C-SMD_KH-TYPE-C-16P]  3.68 5.36 90 bottom
X1  40MHz  [CRYSTAL-SMD_4P-L2.5-W2.0-BL]  20.31 27.08 0 top
X2  32.768kHz  [OSC-SMD_L2.0-W1.2]  13.46 1.42 180 top

## Footprints (pads in the part's own frame, mm; a bottom-side part is the same pattern mirrored in y, then rotated)
302530BAT
  oval 2.5x1.524 smd: 1(1.5,1.3) 2(1.5,-1.3)
C0402
  rect 0.5x0.54 smd: 1(-0.42,0) 2(0.42,0)
C0603
  rect 0.8x0.9 smd: 1(-0.7,0) 2(0.7,0)
CRYSTAL-SMD_4P-L2.5-W2.0-BL
  rect 1.2x1.1 smd: 1(-0.95,-0.75) 2(0.95,-0.75) 3(0.95,0.75) 4(-0.95,0.75)
FILTER-SMD_L5.2-W2.0-L
  rect 1x2 smd: 1(-2.7,0) 2(2.7,0)
FPC-SMD_12P-P0.50_HB-FPC05-GXG-H2012P
  rect 0.3x1.3 smd: 1(-2.75,1.55) 2(-2.25,1.55) 3(-1.75,1.55) 4(-1.25,1.55) 5(-0.75,1.55) 6(-0.25,1.55) 7(0.25,1.55) 8(0.75,1.55) 9(1.25,1.55) 10(1.75,1.55) 11(2.25,1.55) 12(2.749,1.55)
  rect 1.3x2.6 smd: 13(4.6,-1.55) 14(-4.6,-1.55)
L0402
  rect 0.54x0.54 smd: 1(-0.42,0) 2(0.42,0)
L0603
  rect 0.8x0.864 smd: 1(-0.7,0) 2(0.7,0)
LED0603-RD_RED
  rect 0.8x0.8 smd: 1(-0.799,-0.004) 2(0.799,0.004)
LGA-14_L3.0-W2.5-P0.50-BL
  rect 0.28x0.785 smd: 1(-0.75,-1.393) 2(-0.25,-1.393) 3(0.25,-1.393) 4(0.75,-1.393) 8(0.75,1.393) 9(0.25,1.393) 10(-0.25,1.393) 11(-0.75,1.393)
  rect 0.785x0.28 smd: 5(1.143,-0.5) 6(1.143,0) 7(1.143,0.5) 12(-1.143,0.5) 13(-1.143,0) 14(-1.143,-0.5)
LGA-16_L3.0-W3.0-P0.50-BL_SQ
  rect 0.25x0.45 smd: 1(-0.75,-1.263) 2(-0.25,-1.263) 3(0.25,-1.263) 4(0.75,-1.263) 9(0.75,1.263) 10(0.25,1.263) 11(-0.25,1.263) 12(-0.75,1.263)
  rect 0.45x0.25 smd: 5(1.263,-0.75) 6(1.263,-0.25) 7(1.263,0.25) 8(1.263,0.75) 13(-1.263,0.75) 14(-1.263,0.25) 15(-1.263,-0.25) 16(-1.263,-0.75)
OSC-SMD_L2.0-W1.2
  rect 0.7x1.3 smd: 1(-0.75,0) 2(0.75,0)
QFN-56_L7.0-W7.0-P0.40-TL-EP4.0
  rect 0.665x0.2 smd: 1(-3.408,2.6) 2(-3.408,2.2) 3(-3.408,1.8) 4(-3.408,1.4) 5(-3.408,1) 6(-3.408,0.6) 7(-3.408,0.2) 8(-3.408,-0.2) 9(-3.408,-0.6) 10(-3.408,-1) 11(-3.408,-1.4) 12(-3.408,-1.8) 13(-3.408,-2.2) 14(-3.408,-2.6) 29(3.408,-2.6) 30(3.408,-2.2) 31(3.408,-1.8) 32(3.408,-1.4) 33(3.408,-1) 34(3.408,-0.6) 35(3.408,-0.2) 36(3.408,0.2) 37(3.408,0.6) 38(3.408,1) 39(3.408,1.4) 40(3.408,1.8) 41(3.408,2.2) 42(3.408,2.6)
  rect 0.2x0.665 smd: 15(-2.6,-3.408) 16(-2.2,-3.408) 17(-1.8,-3.408) 18(-1.4,-3.408) 19(-1,-3.408) 20(-0.6,-3.408) 21(-0.2,-3.408) 22(0.2,-3.408) 23(0.6,-3.408) 24(1,-3.408) 25(1.4,-3.408) 26(1.8,-3.408) 27(2.2,-3.408) 28(2.6,-3.408) 43(2.6,3.408) 44(2.2,3.408) 45(1.8,3.408) 46(1.4,3.408) 47(1,3.408) 48(0.6,3.408) 49(0.2,3.408) 50(-0.2,3.408) 51(-0.6,3.408) 52(-1,3.408) 53(-1.4,3.408) 54(-1.8,3.408) 55(-2.2,3.408) 56(-2.6,3.408)
  rect 4x4 smd: 57(0,0)
R0603
  rect 0.806x0.864 smd: 1(-0.753,0) 2(0.753,0)
R0603#2
  rect 0.8x0.9 smd: 1(-0.7,0) 2(0.7,0)
SOD-123F_L2.8-W1.8-LS3.7-RD
  rect 1x1.2 smd: 1(-1.55,0) 2(1.55,0)
SOP-8_L4.9-W3.9-P1.27-LS6.0-TL-EP
  oval 1.6x0.6 smd: 1(-3,1.905) 2(-3,0.635) 3(-3,-0.635) 4(-3,-1.905) 5(3,-1.905) 6(3,-0.635) 7(3,0.635) 8(3,1.905)
  rect 3x3.5 smd: 9(0,0)
SOT-23-3_L2.9-W1.3-P1.90-LS2.4-BR
  rect 1.25x0.7 smd: 1(1,-0.95) 2(1,0.95) 3(-1,0)
SOT-23-3_L3.0-W1.7-P0.95-LS2.9-BR
  rect 1.038x0.532 smd: 1(1.101,-0.95) 2(1.101,0.95) 3(-1.101,0)
SOT-23-5_L3.0-W1.7-P0.95-LS2.8-BL
  rect 0.49x1.157 smd: 1(-0.95,-1.153) 2(0,-1.153) 3(0.95,-1.153)
  rect 0.49x1.175 smd: 4(0.95,1.153) 5(-0.95,1.153)
SW-SMD_L3.9-W3.0-P4.45
  rect 1.23x1.36 smd: 1(-2.185,0) 2(2.185,0)
SW-SMD_L4.7-W3.5-P3.35-EH
  rect 0.8x1.4 smd: 1(-1.675,-0.917) 2(1.675,-0.917)
  rect 0.8x1.2 smd: 3(-2.25,0.917) 4(2.25,0.917)
SW-SMD_QS-301-AGS5P
  rect 1.9x1.9 smd: 1(-2.5,-2.325) 2(0,-2.325) 3(2.5,-2.325)
  rect 1.6x1.6 smd: 4(5.4,2.325) 5(-5.4,2.325)
TDFN-8_L3.0-W2.0-P0.50-BL-EP
  rect 0.3x0.75 smd: 1(-0.75,-1.5) 2(-0.249,-1.5) 3(0.25,-1.5) 4(0.75,-1.5) 5(0.75,1.5) 6(0.25,1.5) 7(-0.249,1.5) 8(-0.75,1.5)
  rect 1.5x1.5 smd: 9(-0.001,-0.001)
USB-C-SMD_KH-TYPE-C-16P
  oval 1x2 hole 0.6x1.7: 1(-4.32,1.765) 2(4.32,1.765)
  oval 1x1.8 hole 0.6x1.4: 3(-4.32,-2.415) 4(4.32,-2.415)
  rect 0.3x1.3 smd: A1(-3.35,2.415) A4(-2.55,2.415) A5(-1.25,2.415) A6(-0.25,2.415) A7(0.25,2.415) A8(1.25,2.415) A9(2.55,2.415) A12(3.35,2.415) B1(3.05,2.415) B4(2.25,2.415) B5(1.75,2.415) B6(0.75,2.415) B7(-0.75,2.415) B8(-1.75,2.415) B9(-2.25,2.415) B12(-3.05,2.415)
VSON-8_L2.0-W3.0-P0.50-BL-EP
  rect 0.28x0.665 smd: 1(-0.75,-1.407) 2(-0.25,-1.407) 3(0.25,-1.407) 4(0.75,-1.407) 5(0.75,1.407) 6(0.25,1.407) 7(-0.25,1.407) 8(-0.75,1.407)
  rect 1.6x1.4 smd: 9(0,0)
WSON-8_L5.0-W6.0-P1.27-BL-EP_1
  rect 0.6x0.8 smd: 1(-1.905,-2.825) 2(-0.635,-2.825) 3(0.635,-2.825) 4(1.905,-2.825) 5(1.905,2.825) 6(0.635,2.825) 7(-0.635,2.825) 8(-1.905,2.825)
  rect 4.3x3.4 smd: 9(0,0)

## Nets
As in the schematic.

Pads without a net: LDO2 4; LDO3 4; SW7 3 4; U1 2; U3 3 4 5 6 7 8 12 13 14 15; U5 5 6; U6 6 7 8 9 13 14 21 22 23 28 29 36 37 43 44 45 47 48 49 50 51 52; U12 13 14; U18 3 7; U42 2 3 9 10 11; USB1 A8 B8

## Via types
v1: diameter 0.61, hole 0.305, Top Layer to Bottom Layer, 78 vias

## Routing (per net, layer and track width the routed paths; a pad name or vN(x,y) marks a point on that pad's centre or on a via; arc(x,y) is an arc through that point)
3V3: length 118.9
  Top Layer w0.15: U42.5 6.36,14.88 6.48,14.76 6.48,14.72 6.59,14.61 6.59,13.64 6.48,13.53 6.48,13.1 U42.8
  Top Layer w0.254: U6.56 17.97,23.96 18.16,23.78 21.84,23.78 22,23.93 22,24.62 U6.46 22,24.67 22,25.09 22.16,25.26 23.9,25.26 C9.2 ; U6.56 U6.55 ; U6.56 16.97,24.64 C8.2 ; v1(7.91,10.34) 7.94,10.31 8.25,10.31 8.51,10.57 8.51,13.57 8.25,13.82 U42.12 ; U6.20 19.97,16.32 v1(19.81,16.16)
  Top Layer w0.4: 6.28,11.46 6.36,11.53 U42.8 ; 6.28,11.46 5.65,11.46 4.75,10.56 4.48,10.56 2.47,8.55 C21.1 2.61,8.15 2.61,6.64 2.53,6.57 C18.2 ; 6.28,11.46 6.34,11.46 7.45,10.34 v1(7.91,10.34) ; v1(26.67,28.48) 26.67,28.03 C9.2 ; v1(3.43,14.76) 3.43,15.64 U3.2 3.43,16.6 C14.1 ; C14.1 2.41,17.17 1.14,18.44 C19.1 ; C14.1 4.51,17.68 LDO3.5 6.22,20.4 C29.2 ; 11.37,17.43 v1(12.38,17.43) 13.09,17.43 R1.2 ; v1(14.6,26.32) 15.3,26.32 C8.2 ; v1(22.1,13.51) 22.1,12.67 C10.1 C12.2 C11.1 ; v1(11.94,24.03) 11.44,24.03 R2.2 9,21.59 9,20 R3.2 11.38,19.21 L1.1 ; R8.2 v1(12.33,15.65) 11.37,15.65 ; v1(25.15,8.92) R25.2 23.87,11.56 U17.8
  PWR w0.254: v1(19.81,16.16) 20.57,15.39 20.57,14.25 21.32,13.51 v1(22.1,13.51)
  PWR w0.4: v1(3.43,14.76) 6.22,11.97 6.28,11.97 v1(7.91,10.34) 10.06,10.34 12.33,12.61 v1(12.33,15.65) 12.73,15.25 18.9,15.25 v1(19.81,16.16) ; v1(12.38,17.43) 11.68,18.13 11.68,23.78 v1(11.94,24.03) 14.22,26.32 v1(14.6,26.32)
  Bottom Layer w0.254: U12.4 U12.3 19.32,14.92 19.32,15.62 19.81,16.11 v1(19.81,16.16)
  Bottom Layer w0.4: v1(22.1,13.51) 23.35,13.51 25.15,11.71 v1(25.15,8.92) ; v1(12.38,17.43) 12.33,17.37 v1(12.33,15.65) ; LED1.2 26.29,28.85 v1(26.67,28.48)
GND: length 33.2
  Top Layer w0.254: X1.4 19.36,29.06 v1(19.18,29.24) ; 5.39,9.68 5.27,9.68 5.02,9.43 4.97,9.43 4.12,8.57 4.12,8.53 C21.2 ; U3.9 2.52,13.21 2.52,13.46 2.68,13.62 3.17,13.62 3.33,13.46 3.33,13.21 U3.11 ; C7.2 23.03,26.33 X1.2 ; U42.7 U42.6 ; U5.4 15,7.28 U5.9 15,8.78 U5.1 ; C5.1 10.41,15.08 v1(10.41,14.91) ; 5.97,13.74 5.93,13.78 5.93,13.14 C15.2 v1(3.71,11.46)
  Top Layer w0.4: v1(12.57,22.4) 13.16,22.4 C3.1 ; R6.1 v1(8.59,19.41)
  Bottom Layer w0.254: U12.5 18.32,14.92 18.32,15.62 19.5,16.79 20,16.79 20.4,16.4 20.4,15.36 20.25,15.21 U12.1 ; R17.2 8.26,15.45 U2.3 ; v1(14.35,14.38) 14.75,14.78 U12.12 14.82,14.78 14.82,14.08 14.98,13.92 16.52,13.92 16.68,14.08 16.82,14.08 16.98,13.92 17.52,13.92 17.68,14.08 17.68,14.78 U12.6 ; R13.1 20.46,28.86 v1(20.99,29.39) ; C30.1 5.14,12.89 v1(3.71,11.46)
  vias: v1(1.02,3.97) v1(3.4,4.01) v1(7.62,12.09) v1(10.41,17.3) v1(12.34,20.6) v1(12.45,18.95) v1(15.23,10.59) v1(19.3,0.79) v1(22.86,0.6) v1(23.11,26.8) v1(27.05,15.01) v1(27.05,13.87) v1(27.81,12.73) v1(29.21,15.27)
VBAT: length 34.6
  Top Layer w0.4: Q2.3 v1(19.43,8.16) ; LDO3.3 2.61,22.51 C20.1 C28.2 4.51,22.51 LDO3.1
  PWR w0.4: v1(19.43,8.16) 18.67,8.92 11.6,8.92 11.32,9.19 10.78,9.19 10.5,8.92 7.95,8.92 2.54,14.32 v1(2.54,22)
VBAT+: length 41
  Top Layer w0.254: C25.1 13.15,7.78 U5.3 14.25,8.16
  Top Layer w0.4: v1(11.56,6.76) 11.46,6.76 D1.2 9.65,8.56 v1(9.65,11.33) ; v1(19.69,5.11) 20.38,4.41 Q2.2 20.38,3.02 R22.1
  PWR w0.4: v1(11.56,6.76) 12.42,6.76 v1(13.54,7.88) 16.92,7.88 v1(19.69,5.11) ; v1(9.65,11.33) 11.07,12.75 11.07,17.49 11.05,17.51 11.05,18.7 9.22,20.53 v1(7.62,20.53)
  Bottom Layer w0.4: 7.11,21.19 7.27,21.03 7.27,20.88 v1(7.62,20.53) ; 7.11,21.19 7.11,21.36 6.6,21.87 3.56,21.87 2.19,20.5 U7.1 ; 7.11,21.19 6.97,21.05 C31.1
VBUS: length 44.5
  Top Layer w0.4: v1(3.81,3.37) 3.01,2.57 C23.2 2.48,4.21 2.96,4.69 2.96,5.19 3.26,5.49 3.85,5.49 4.15,5.19 4.15,4.69 4.51,4.34 5.64,4.34 C22.1
  PWR w0.4: v1(5.72,15.65) 5.72,21.87 v1(7.11,23.27) 8.76,23.27 v1(10.41,21.62)
  Bottom Layer w0.254: 4.3,6.91 4.87,7.47 5.24,7.47 5.38,7.61 USB1.B4 ; C30.2 6.86,12.98 7.87,14 7.87,14.76 7.44,15.19 7.11,15.19 ; USB1.B9 6.03,3.18 5.33,3.18 5.15,3.37 v1(3.81,3.37)
  Bottom Layer w0.4: v1(3.81,3.37) 4.3,3.86 4.3,6.91 3.81,7.4 3.81,9.93 6.54,12.67 C30.2 ; v1(5.72,15.65) 6.65,15.65 7.11,15.19 ; v1(7.11,23.27) 6.99,23.27 6.61,22.89 ; 11.29,22.89 11.29,21.56 10.92,21.19 10.49,21.62 v1(10.41,21.62)
BMI_INT: length 14.2
  Top Layer w0.15: U42.4 6.36,17.44 7.11,18.19 15.11,18.19 15.62,18.7 15.62,19.59 16.27,20.24 U6.10
BOOT: length 14.9
  Top Layer w0.15: v1(12.43,23.16) 12.07,23.16 R2.1 ; v1(14.52,19.77) 14.52,19.1 C2.2 15.3,19.58 15.3,20.72 16.81,22.24 U6.5 v1(17.91,22.24)
  Bottom Layer w0.15: v1(14.52,19.77) 14.52,22.21 13.57,23.16 v1(12.43,23.16) ; v1(17.91,22.24) 17.91,24.39 SW2.2
CHRG: length 22.3
  Top Layer w0.15: v1(26.03,24.67) 26.03,24.16 25.39,23.51 24.05,23.51 U6.41
  Bottom Layer w0.15: v1(26.03,24.67) 25.15,25.56 12.45,25.56 9.79,22.89 9.79,21.32 9.65,21.19
CTL: length 18.6
  Top Layer w0.15: v1(26.8,11.14) 27.18,10.76 27.18,4.34 R23.1 ; v1(21.3,16.95) 21.3,17.21 21.59,17.49 21.59,17.81 U6.24
  Bottom Layer w0.15: v1(26.8,11.14) 26.8,11.38 21.3,16.88 v1(21.3,16.95)
ESP_EN: length 12.7
  Top Layer w0.15: R3.1 9.91,20.72 10.67,19.97 13.91,19.97 C1.2 15.05,21.11 ; U6.4 16.58,22.64 15.05,21.11 ; v1(15.05,21.6) 15.05,21.11
  Bottom Layer w0.15: v1(15.05,21.6) 15.05,23.71 14.12,24.64 SW3.2
ESP_SCL: length 38.4
  Top Layer w0.15: v1(11.05,8.54) 11.51,8.54 12.15,7.9 12.15,6.96 12.63,6.48 13.57,6.48 13.72,6.33 ; 13.72,6.33 13.82,6.44 17.59,6.44 18.03,6.89 18.03,8.03 17.78,8.28 U5.7 ; 13.72,6.33 13.72,5.88 U18.6 ; 8.72,14.38 8.72,14.33 9.1,13.95 v1(9.1,13.8) ; 8.72,14.38 13.45,14.38 R8.1 15.49,16.42 15.49,17.55 16.26,18.32 16.26,19.2 16.49,19.44 U6.12 ; 8.72,14.38 U42.13 ; v1(4.65,16.33) 4.61,16.33 U3.1
  Bottom Layer w0.15: v1(11.05,8.54) 8.89,10.69 8.89,13.59 v1(9.1,13.8) 9.1,16.09 8.6,16.6 8.35,16.6 8.34,16.6 4.93,16.6 v1(4.65,16.33)
ESP_SDA: length 36.5
  Top Layer w0.15: U18.5 14.21,6.12 17.65,6.12 18.29,6.76 18.29,8.28 17.79,8.78 U5.8 16.99,9.03 v1(16.99,13.24) ; R1.1 15.88,18.45 15.88,19.33 16.38,19.84 U6.11 ; R1.1 13.96,16.54 9.69,16.54 9.12,15.97 9.12,15.25 8.75,14.88 U42.14 8.25,14.89 7.91,14.89 7.23,14.21 v1(7.23,14.18) 7.14,14.18 7.07,14.11 ; R1.1 14.47,17.55 14.33,17.55 v1(14.08,17.3) ; U3.16 4.49,15.19 v1(5.02,15.19)
  Bottom Layer w0.15: v1(7.23,14.18) 6.29,14.18 5.29,15.19 v1(5.02,15.19) ; v1(16.99,13.24) 14.73,13.24 13.46,14.5 13.46,16.69 v1(14.08,17.3)
KEY1: length 3.5
  Top Layer w0.15: v1(25.8,23.04) 23.99,23.04 U6.40
  Bottom Layer w0.15: v1(25.8,23.04) 24.22,23.04 U21.3
KEY2: length 4.8
  Top Layer w0.15: v1(25.97,21.83) 25.97,22.12 25.45,22.64 U6.39
  Bottom Layer w0.15: v1(25.97,21.83) 24.79,20.65 24.32,20.65 U21.2
KEY3: length 8.4
  Top Layer w0.15: v1(27.07,18.84) 27.07,19.95 24.78,22.24 U6.38
  Bottom Layer w0.15: U21.1 26.23,18 27.07,18.84
KEY4: length 10.6
  Top Layer w0.15: U6.27 22.77,9.33 R25.1 22.35,8.91 D3.2
LEDK: length 2.7
  Top Layer w0.15: v1(19.43,13.62) 19.37,13.62 R16.2
  Bottom Layer w0.15: v1(19.43,13.62) 19.75,13.94 U12.2
SPICLK: length 9.9
  Top Layer w0.15: v1(24.16,16.59) 24.16,16.1 24.22,16.04 24.22,15.01 U17.6 ; v1(25.68,17) 26.16,17.49 26.16,20.1 25.84,20.42 24.71,20.42 24.53,20.24 U6.33
  Bottom Layer w0.15: v1(25.68,17) 25.34,16.67 24.23,16.67 v1(24.16,16.59)
SPICS: length 13.2
  Top Layer w0.15: v1(25.62,19.89) 25.57,19.84 U6.32 ; U17.1 28.48,11.08 v1(28.45,11.08)
  PWR w0.15: v1(28.45,11.08) 27.61,11.08 26.21,12.48 26.21,19.3 v1(25.62,19.89)
SPID: length 5.9
  Top Layer w0.15: 23.46,15.65 23.5,15.69 23.5,18.26 23.42,18.33 23.42,20.83 23.56,20.96 23.91,20.96 U6.35
SPIHD: length 7.6
  Top Layer w0.15: U6.30 24.93,19.04 25.15,18.82 25.15,16.67 24.49,16.01 24.49,14.01 U17.7
SPIQ: length 11
  Top Layer w0.15: U17.2 28.34,14.01 28.34,16.21 26.54,18.01 26.54,20.12 25.95,20.71 24.05,20.71 U6.34
SPIWP: length 9.9
  Top Layer w0.15: v1(28.7,17.02) 28.61,16.93 28.61,14.85 29.08,14.38 U17.3 ; v1(25.59,19.13) 25.29,19.44 U6.31
  Bottom Layer w0.15: v1(28.7,17.02) 28.72,17.04 28.72,18.37 27.63,19.47 25.97,19.47 25.63,19.13 v1(25.59,19.13)
STDBY: length 23.1
  Top Layer w0.15: v1(21.22,18.78) 22.44,18.78 22.86,19.2 22.86,23.14 23.56,23.84 U6.42
  Bottom Layer w0.15: 8.12,22.89 8.38,22.63 U2.6 8.38,20.73 8.81,20.3 11.89,20.3 12.12,20.07 12.72,20.07 14.01,18.78 v1(21.22,18.78)
TFT_BLK: length 11.1
  Top Layer w0.15: R10.2 12.07,13.24 14.59,13.24 14.8,13.44 14.81,13.44 15.88,14.51 15.88,17.43 16.28,17.83 U6.15
TFT_DC: length 4.4
  Top Layer w0.15: U6.19 19.57,17.09 18.6,16.11 v1(17.94,16.11)
  Bottom Layer w0.15: v1(17.94,16.11) 17.89,16.11 17.27,15.49 17.27,14.87 U12.7
TFT_RES: length 5.7
  Top Layer w0.15: v1(16.44,17.24) 18.14,17.24 18.41,17.52 18.41,17.79 U6.16
  Bottom Layer w0.15: v1(16.44,17.24) 15.82,17.24 15.24,16.67 15.24,15.9 15.25,15.89 U12.11
TFT_SCL: length 4.9
  Top Layer w0.15: U6.18 19.18,17.83 19.18,17.17 18.67,16.67 17.68,16.67 v1(17.17,16.16)
  Bottom Layer w0.15: v1(17.17,16.16) 16.94,16.16 16.26,15.48 16.26,14.86 U12.9
TFT_SDA: length 5.1
  Top Layer w0.15: v1(16.41,16.44) 16.89,16.92 18.41,16.92 18.8,17.3 18.8,17.81 U6.17
  Bottom Layer w0.15: U12.10 15.75,15.78 16.41,16.44
UD+: length 26.5
  Top Layer w0.254: v1(22.1,15.33) 22.1,16.16 22.37,16.43 U6.26 ; v1(7.93,3.94) 7.4,4.47 v1(7.4,5.25)
  Bottom Layer w0.254: v1(7.93,3.94) 11.16,3.94 22.1,14.89 v1(22.1,15.33) ; USB1.B6 7,6.11 7.24,5.88 7.24,5.65 ; v1(7.4,5.25) 7.4,5.49 7.24,5.65 ; 7.24,5.65 7.24,5.34 7.07,5.18 6.38,5.18 6.31,5.11
UD-: length 25.4
  Top Layer w0.254: U6.25 21.97,17.83 21.97,16.79 21.34,16.16 v1(21.34,15.39)
  Bottom Layer w0.254: USB1.A7 6.03,5.54 5.33,5.54 5.17,5.38 5.17,4.85 5.33,4.68 6.03,4.68 USB1.B7 6.24,4.61 6.24,4.61 11.25,4.61 21.34,14.7 v1(21.34,15.39)
XTAL_N: length 6.3
  Top Layer w0.254: C7.1 22.93,27.83 X1.3 21.21,27.83 20.38,27 20.38,25.81 20.07,25.5 19.61,25.5 19.19,25.09 19.19,24.67 U6.53
XTAL_P: length 3.8
  Top Layer w0.254: 19.15,26.12 X1.1 ; 19.15,26.12 18.77,25.75 U6.54 ; 19.15,26.12 C13.2
$1N92: length 5.1
  Top Layer w0.254: U6.1 15.94,23.84 arc(14.96,24.03) 14.14,24.58 12.9,25.82 arc(12.88,25.86) 12.87,25.89
$1N111: length 6.2
  Top Layer w0.254: 6.86,28.09 9.57,28.09 arc(10.55,27.9) 11.37,27.35 L4.1 arc(11.64,27.11) 11.67,27.09 C6.1
$1N112: length 7.2
  Top Layer w0.15: L1.2 11.5,20.67 12.45,21.62 13.84,21.62 14.67,22.44 C3.2 15.2,23.04 U6.3 U6.2
$1N141: length 1.9
  Bottom Layer w0.15: LED1.1 23.71,28.86 R13.2
$1N183: length 14.5
  Top Layer w0.15: 18.48,4.39 18.48,3.02 R22.2 19.69,1.81 22.1,1.81 22.86,2.57 Q5.3 22.86,3.33 22.84,3.35 21.68,3.35 21.34,3.69 21.34,4.77 22.44,5.87 23.09,5.87 D2.2
$1N184: length 6.3
  Top Layer w0.15: R23.2 25.39,1.05 24.38,2.06 22.73,2.06 21.91,1.24 Q5.1 21.8,1.04 R24.2
$1N187: length 4.8
  Top Layer w0.15: v1(25.78,4.32) D2.1 D3.1
  Bottom Layer w0.15: v1(25.78,4.32) 27.18,4.32 SW7.1
$1N194: length 2.3
  Bottom Layer w0.15: R17.1 9.77,15.07 9.65,15.19
$1N208: length 1.7
  Top Layer w0.15: C15.1 2.93,11.53 U3.10
$1N222: length 3.5
  Top Layer w0.15: R5.2 8.75,2.95 v1(7.62,2.95)
  Bottom Layer w0.15: 6.31,4.11 7.09,4.11 7.24,3.97 7.24,3.33 v1(7.62,2.95)
$1N223: length 2.5
  Top Layer w0.15: R4.1 8.6,7.11 v1(7.49,7.11)
  Bottom Layer w0.15: 6.31,7.11 v1(7.49,7.11)
$1N228: length 2.6
  Top Layer w0.15: D1.1 10.9,4.32 12.46,5.88 U18.8
$1N236: length 1.8
  Top Layer w0.15: R6.2 7.86,17.17 U42.1
$1N245: length 3.6
  Top Layer w0.15: C16.1 12.65,1.36 X2.2
  Top Layer w0.254: X2.2 U18.1
$1N246: length 3.9
  Top Layer w0.15: C17.1 15.94,1.42 X2.1
  Top Layer w0.254: U18.2 13.21,2.56 14.21,1.56 X2.1
$1N265: length 3.4
  Top Layer w0.15: 14.29,10.46 14.17,10.58 R9.2 R10.1
$1N297: length 2.8
  Top Layer w0.15: R16.1 15.23,12.65 Q3.3

## Copper pours and planes (outline as drawn; the poured copper is in the pictures)
GND on Top Layer: -1.65,31.27 31.24,31.27 31.24,-0.35 -1.65,-0.35
GND on Bottom Layer: -1.27,31.02 30.99,31.02 30.99,-0.99 -1.27,-0.99
GND on GND: 0.26,29.74 29.74,29.74 29.74,0.26 0.26,0.26

Small or netless copper shapes (teardrops, artwork), in the pictures only: 226 on Top Layer, 98 on Bottom Layer, 12 on GND, 24 on PWR

## Text on the board
Bottom Silkscreen Layer: EN
